# Altium schematic sheet PFC-Sheet.SchDoc (part 1 of 4)
size 420 x 297 mm; SheetNumber: 2; SheetTotal: 4
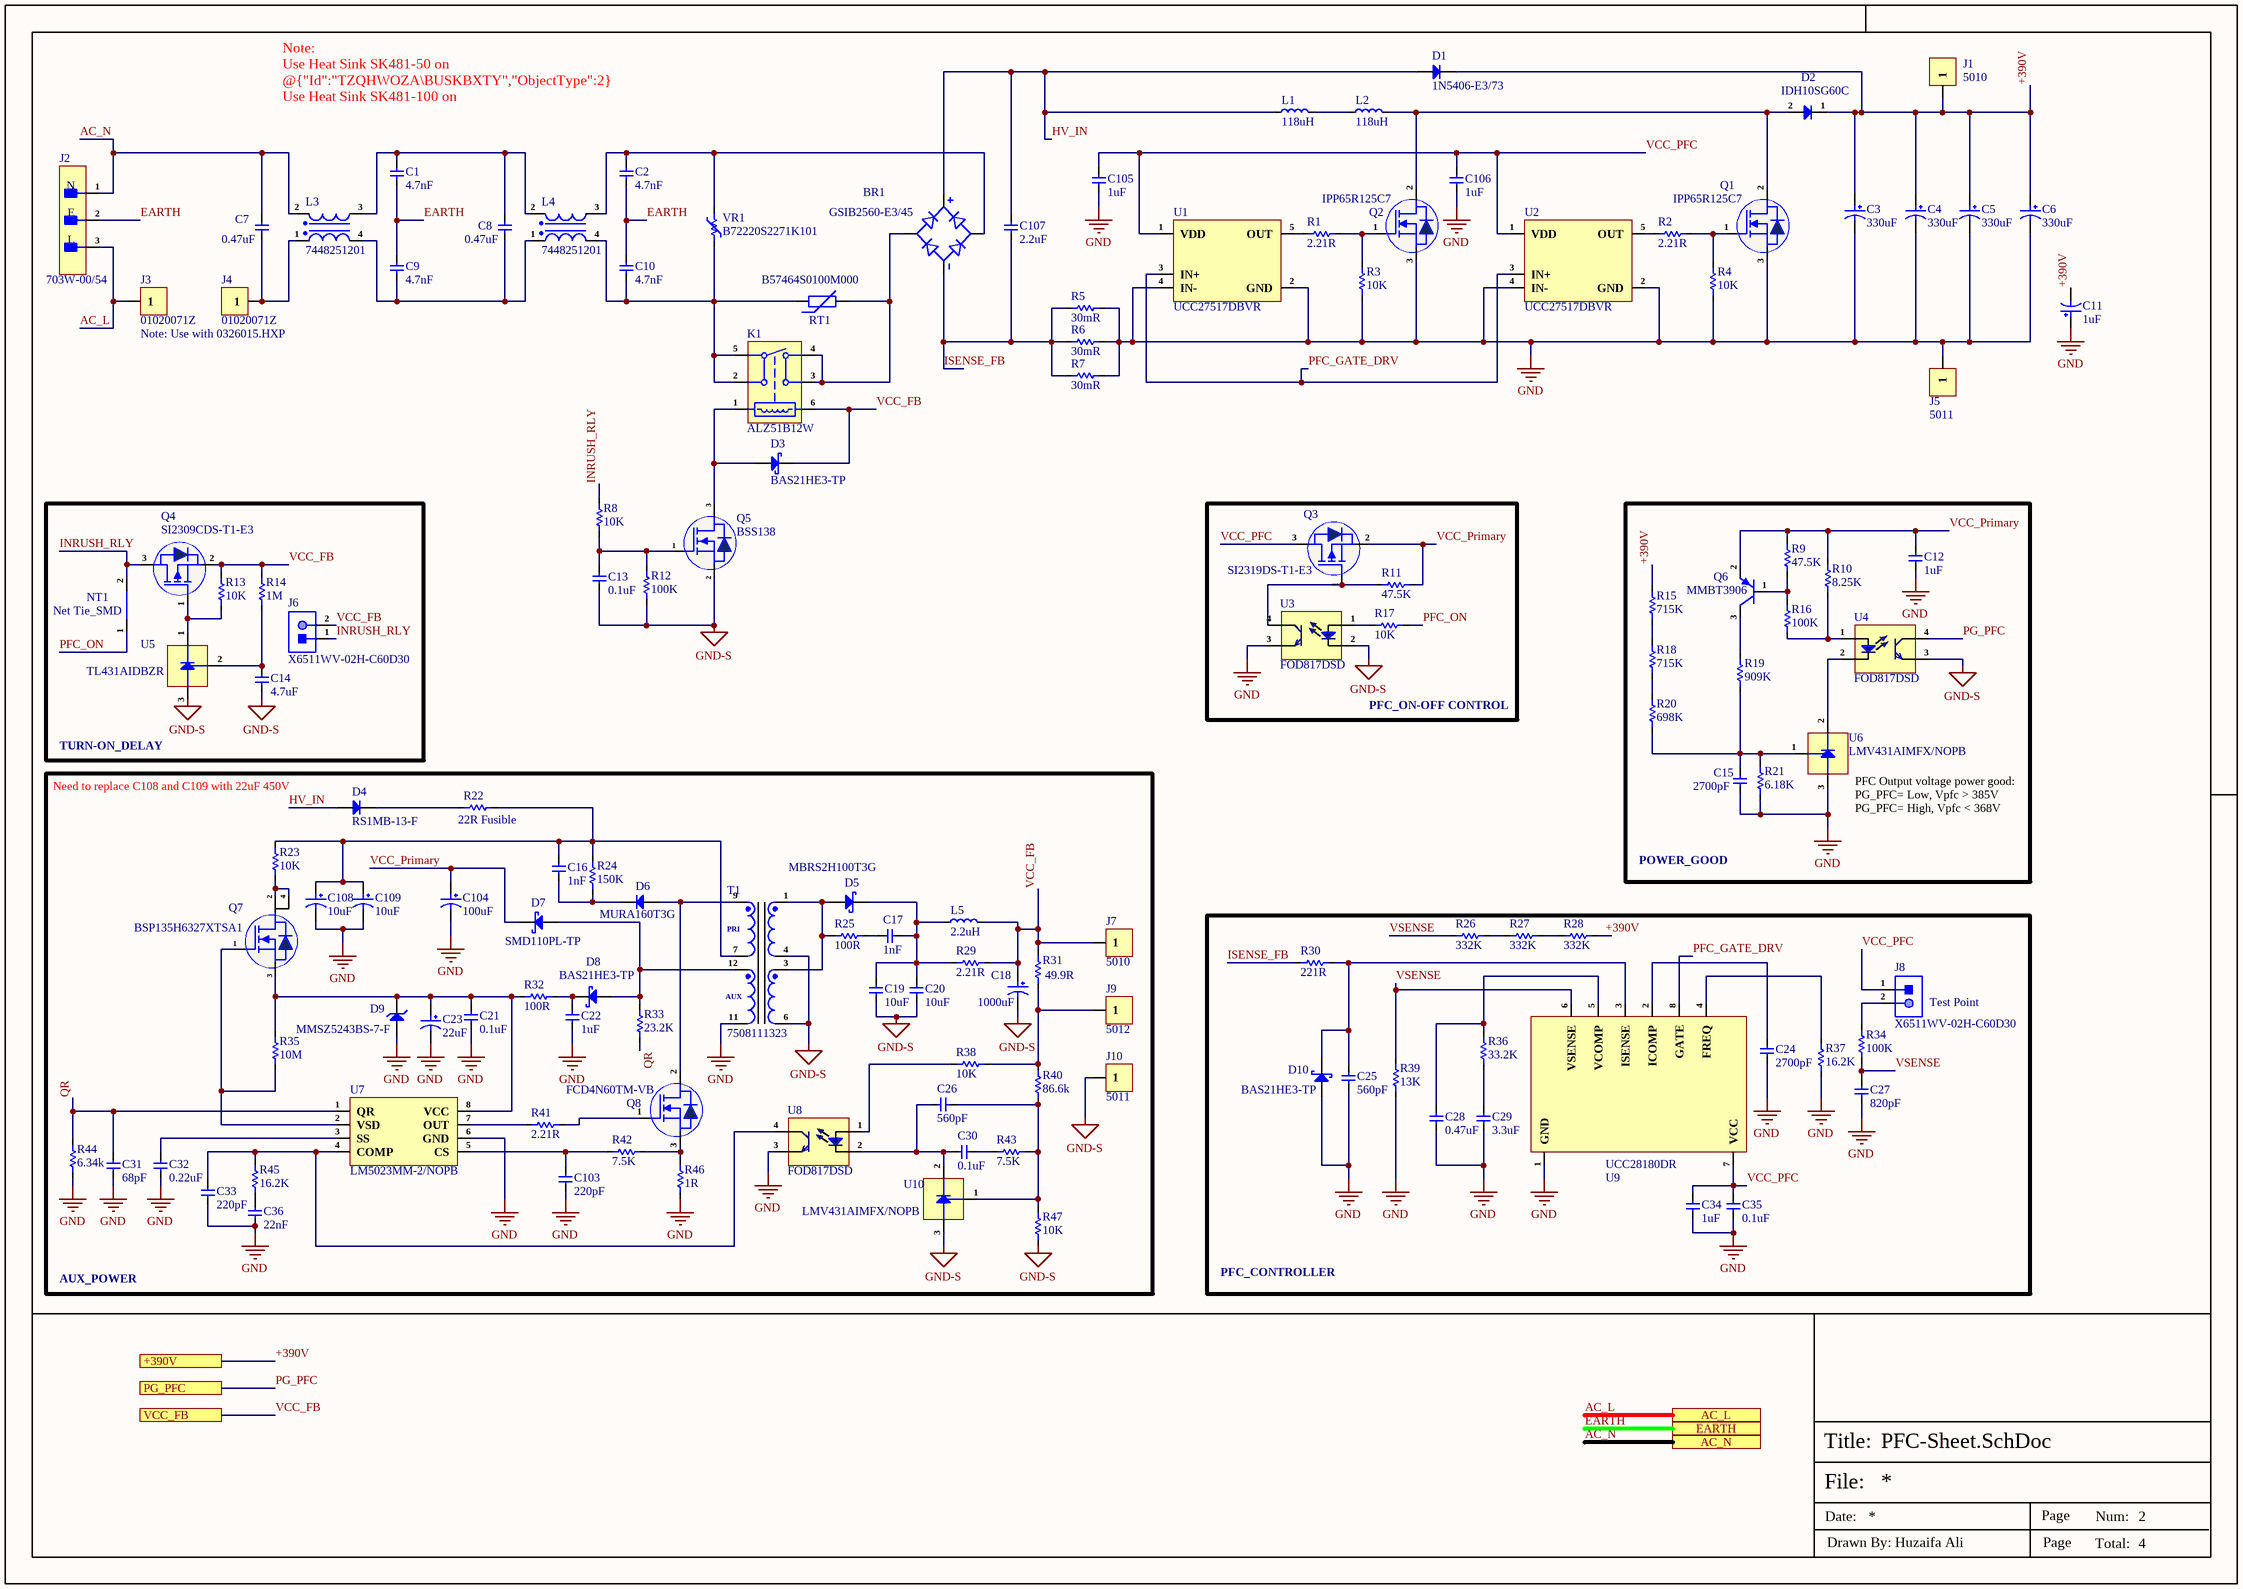
[diagram p0: PFC-Sheet.SchDoc]

## Parts
BR1  GSIB2560-E3/45  [GSIB-5S]
C1  4.7nF  [C771U472MYWDBA7317]
C2  4.7nF  [C771U472MYWDBA7317]
C3  330uF  [381LR331M450K052]
C4  330uF  [381LR331M450K052]
C5  330uF  [381LR331M450K052]
C6  330uF  [381LR331M450K052]
C7  0.47uF  [B32933A3474M000]
C8  0.47uF  [B32933A3474M000]
C9  4.7nF  [C771U472MYWDBA7317]
C10  4.7nF  [C771U472MYWDBA7317]
C11  1uF  [R75PR4100AA30K]
C12  1uF  [Cap-0603]
C13  0.1uF  [Cap-0603]
C14  4.7uF  [Cap-0603]
C15  2700pF  [Cap-0603]
C16  1nF  [Cap-0805]
C17  1nF  [Cap-0805]
C18  1000uF  [EEU-FM1C102B]
C19  10uF  [Cap-1210]
C20  10uF  [Cap-1210]
C21  0.1uF  [Cap-0603]
C22  1uF  [Cap-0603]
C23  22uF  [EEEFK1H220P]
C24  2700pF  [Cap-0603]
C25  560pF  [Cap-0603]
C26  560pF  [Cap-0603]
C27  820pF  [Cap-0603]
C28  0.47uF  [Cap-0603]
C29  3.3uF  [Cap-1210]
C30  0.1uF  [Cap-0603]
C31  68pF  [Cap-0603]
C32  0.22uF  [Cap-0603]
C33  220pF  [Cap-0603]
C34  1uF  [Cap-0603]
C35  0.1uF  [Cap-0603]
C36  22nF  [Cap-0603]
C103  220pF  [Cap-0603]
C104  100uF  [25SVPF100M.]
C105  1uF  [Cap-0603]
C106  1uF  [Cap-0603]
C107  2.2uF  [ECW-FA2J225J]
C108  10uF  [ERK2GM100G10OT]
C109  10uF  [ERK2GM100G10OT]
D1  1N5406-E3/73  [DO-201AD]
D2  IDH10SG60C  [TO-220-2]
D3  BAS21HE3-TP  [SOT-23]
D4  RS1MB-13-F  [SMB_]
D5  MBRS2H100T3G  [SMB_]
D6  MURA160T3G  [SMA]
D7  SMD110PL-TP  [SOD-123FL]
D8  BAS21HE3-TP  [SOT-23]
D9  MMSZ5243BS-7-F  [SOD-323]
D10  BAS21HE3-TP  [SOT-23]
J1  5010  [5010]
J2  703W-00/54  [703W-00/54]
J3  01020071Z  [01020071Z]
J4  01020071Z  [01020071Z]
J5  5011  [5011]
J6  X6511WV-02H-C60D30  [HDR1X2_]
J7  5010  [5010]
J8  X6511WV-02H-C60D30  [HDR1X2_]
J9  5012  [5012]
J10  5011  [5011]
K1  ALZ51B12W  [ALZ51B12W]
L1  118uH  [760801401]
L2  118uH  [760801401]
L3  7448251201  [7448251201]
L4  7448251201  [7448251201]
L5  2.2uH  [7447745022]
NT1  Net Tie_SMD  [Net Tie Pad]  (net tie, no BOM)
Q1  IPP65R125C7  [TO-220-3]
Q2  IPP65R125C7  [TO-220-3]
Q3  SI2319DS-T1-E3  [SOT-23]
Q4  SI2309CDS-T1-E3  [SOT-23]
Q5  BSS138  [Sot-23]
Q6  MMBT3906  [SOT-23]
Q7  BSP135H6327XTSA1  [SOT- 223]
Q8  FCD4N60TM-VB  [TO-252-2L]
R1  2.21R  [RES-0805]
R2  2.21R  [RES-0805]
R3  10K  [Res-0603]
R4  10K  [Res-0603]
R5  30mR  [RES-2512]
R6  30mR  [RES-2512]
R7  30mR  [RES-2512]
R8  10K  [Res-0603]
R9  47.5K  [Res-0603]
R10  8.25K  [Res-0603]
R11  47.5K  [Res-0603]
R12  100K  [Res-0603]
R13  10K  [Res-0603]
R14  1M  [RES-0805]
R15  715K  [Res-1206]
R16  100K  [Res-0603]
R17  10K  [Res-0603]
R18  715K  [Res-1206]
R19  909K  [Res-0603]
R20  698K  [Res-1206]
R21  6.18K  [Res-0603]
R22  22R Fusible  [EMC2-22RKI]
R23  10K  [RES-2512]
R24  150K  [RES-2010]
R25  100R  [Res-1206]
R26  332K  [Res-1206]
R27  332K  [Res-1206]
R28  332K  [Res-1206]
R29  2.21R  [RES-0805]
R30  221R  [Res-0603]
R31  49.9R  [Res-0603]
R32  100R  [Res-1206]
R33  23.2K  [Res-0603]
R34  100K  [Res-0603]
R35  10M  [Res-1206]
R36  33.2K  [Res-0603]
R37  16.2K  [Res-0603]
R38  10K  [Res-0603]
R39  13K  [Res-0603]
R40  86.6k  [Res-0603]
R41  2.21R  [RES-0805]
R42  7.5K  [Res-0603]
R43  7.5K  [Res-0603]
R44  6.34k  [Res-0603]
R45  16.2K  [Res-0603]
R46  1R  [Res-1206]
R47  10K  [Res-0603]
RT1  B57464S0100M000  [B57464S0100M000]
T1  7508111323  [7508111323]
U1  UCC27517DBVR  [SOT-23-5]
U2  UCC27517DBVR  [SOT-23-5]
U3  FOD817DSD  [FOD817DSD]
U4  FOD817DSD  [FOD817DSD]
U5  TL431AIDBZR  [SOT-23]
U6  LMV431AIMFX/NOPB  [SOT-23]
U7  LM5023MM-2/NOPB  [VSSOP-8-0.65mm]
U8  FOD817DSD  [FOD817DSD]
U9  UCC28180DR  [SOIC-8]
U10  LMV431AIMFX/NOPB  [SOT-23]
VR1  B72220S2271K101  [B72220S2271K101]

## Blocks framed on the sheet
TURN-ON_DELAY: C14 J6 NT1 Q4 R13 R14 U5
PFC_ON-OFF CONTROL: Q3 R11 R17 U3
POWER_GOOD: C12 C15 Q6 R9 R10 R15 R16 R18-R21 U4 U6

## Ports
+390V (see Top-Sheet[2B], Power-Sheet[1D]), AC_L (see Top-Sheet[1B]), AC_N (see Top-Sheet[1B]), EARTH (see Top-Sheet[1B], Power-Sheet[5D]), PG_PFC (see Top-Sheet[2B], Control-Sheet[1D], Power-Sheet[1D]), VCC_FB (see Top-Sheet[2B], Control-Sheet[1D], Power-Sheet[1D])

## Nets
GND: C3.2 C4.2 C5.2 C6.2 C11.1 C12.1 C15.1 C21.1 C22.1 C23.2 C24.1 C25.1 C27.1 C28.1 C29.1 C31.1 C32.1 C33.1 C34.1 C35.1 C36.1 C103.1 C104.2 C105.1 C106.1 C108.2 C109.2 D9.2(A) D10.1(A) J5.1 Q1.3(S) Q2.3(S) R3.1 R4.1 R5.2 R6.2 R7.2 R21.1 R37.2 R39.1 R44.1 R46.1 T1.11 U1.2(GND) U1.4(IN-) U2.2(GND) U2.4(IN-) U3.3(E) U6.3(Anode) U7.6(GND) U8.3(E) U9.1(GND)
GND-S: C13.1 C14.1 C18.2 C19.1 C20.1 J10.1 Q5.2(S) R12.1 R47.1 T1.4 T1.6 U3.2(Ca) U4.3(E) U5.3(Anode) U10.3(Anode)
+390V: C3.1 C4.1 C5.1 C6.1 C11.2 D1.1(K) D2.1(K) J1.1 R15.2 R28.2 ; port +390V
AC_L: J2.3(L) J3.1 ; port AC_L
AC_N: C7.2 J2.1(N) L3.2 ; port AC_N
EARTH: C1.1 C2.1 C9.2 C10.2 J2.2(E) ; port EARTH
HV_IN: BR1.POS C107.2 D1.2(A) D4.1(A) L1.1
INRUSH_RLY: J6.1 NT1.2 Q4.3(D) R8.2
ISENSE_FB: BR1.NEG C107.1 R5.1 R6.1 R7.1 R30.1
PFC_GATE_DRV: U1.3(IN+) U2.3(IN+) U9.8(GATE)
PFC_ON: NT1.1 R17.2
PG_PFC: U4.4(C) ; port PG_PFC
QR: C31.2 R33.1 R44.2 U7.1(QR)
VCC_FB: C18.1 D3.3(K) J6.2 J7.1 K1.6 L5.2 Q4.2(S) R13.2 R14.2 R29.2 R31.2 ; port VCC_FB
VCC_PFC: C34.2 C35.2 C105.2 C106.2 J8.1 Q3.3(D) U1.1(VDD) U2.1(VDD) U9.7(VCC)
VCC_Primary: C12.2 C104.1 D7.1(K) Q3.2(S) Q6.2(E) R9.2 R10.2 R11.2
VSENSE: C27.2 R26.1 R34.1 R39.2 U9.6(VSENSE)
NetBR1_AC1: BR1.AC1 C2.2 L4.3 VR1.2
NetBR1_AC2: BR1.AC2 K1.3 K1.4 RT1.2
NetC1_2: C1.2 C8.2 L3.3 L4.2
NetC7_1: C7.1 J4.1 L3.1
NetC8_1: C8.1 C9.1 L3.4 L4.1
NetC10_1: C10.1 K1.2 K1.5 L4.4 RT1.1 VR1.1
NetC13_2: C13.2 Q5.1(G) R8.1 R12.2
NetC14_2: C14.2 R14.1 U5.2(REF)
NetC15_2: C15.2 R19.1 R20.1 R21.2 U6.1(REF)
NetC16_1: C16.1 D6.1(K) R24.1
NetC16_2: C16.2 C108.1 C109.1 R22.1 R23.2 R24.2 T1.7
NetC17_1: C17.1 C19.2 C20.2 D5.2(K) L5.1 R29.1
NetC17_2: C17.2 R25.2
NetC21_2: C21.2 C23.1 D9.1(K) Q7.3(S) R32.1 R35.2 U7.8(VCC)
NetC22_2: C22.2 D8.3(K) R32.2
NetC24_2: C24.2 U9.2(ICOMP)
NetC25_2: C25.2 D10.3(K) R30.2 U9.3(ISENSE)
NetC26_1: C26.1 C30.2 U8.2(Ca) U10.2(Cathode)
NetC26_2: C26.2 R40.1 R43.2 R47.2 U10.1(REF)
NetC28_2: C28.2 R36.2 U9.5(VCOMP)
NetC29_2: C29.2 R36.1
NetC30_1: C30.1 R43.1
NetC32_2: C32.2 U7.3(SS)
NetC33_2: C33.2 R45.2 U7.4(COMP) U8.4(C)
NetC36_2: C36.2 R45.1
NetC103_2: C103.2 R42.1 U7.5(CS)
NetD2_2: D2.2(A) L2.2 Q1.2(D) Q2.2(D)
NetD3_1: D3.1(A) K1.1 Q5.3(D)
NetD4_2: D4.2(K) R22.2
NetD5_1: D5.1(A) R25.1 T1.1 T1.3
NetD6_2: D6.2(A) Q8.2(D) T1.9
NetD7_2: D7.2(A) D8.1(A) R33.2 T1.12
NetJ8_2: J8.2 R34.2
NetJ9_1: J9.1 R31.1 R38.2 R40.2
NetL1_2: L1.2 L2.1
NetQ1_1: Q1.1(G) R2.2 R4.2
NetQ2_1: Q2.1(G) R1.2 R3.2
NetQ3_1: Q3.1(G) R11.1 U3.4(C)
NetQ4_1: Q4.1(G) R13.1 U5.1(Cathode)
NetQ6_1: Q6.1(B) R9.1 R16.2
NetQ6_3: Q6.3(C) R19.2
NetQ7_1: Q7.1(G) R35.1 U7.2(VSD)
NetQ7_2: Q7.2(D) Q7.4(D) R23.1
NetQ8_1: Q8.1(G) R41.2
NetQ8_3: Q8.3(S) R42.2 R46.2
NetR1_1: R1.1 U1.5(OUT)
NetR2_1: R2.1 U2.5(OUT)
NetR10_1: R10.1 R16.1 U4.1(An)
NetR15_1: R15.1 R18.2
NetR17_1: R17.1 U3.1(An)
NetR18_1: R18.1 R20.2
NetR26_2: R26.2 R27.1
NetR27_2: R27.2 R28.1
NetR37_1: R37.1 U9.4(FREQ)
NetR38_1: R38.1 U8.1(An)
NetR41_1: R41.1 U7.7(OUT)
NetU4_2: U4.2(Ca) U6.2(Cathode)

## Notes on the sheet
- Note:
  Use Heat Sink SK481-50 on @{"Id":"TZQHWOZA\BUSKBXTY","ObjectType":2}
  Use Heat Sink SK481-100 on @{"Id":"TZQHWOZA\QHEAVWIM","ObjectType":2} @{"Id":"TZQHWOZA\GOCLJIOY","ObjectType":2} & @{"Id":"TZQHWOZA\RKNUICFK","ObjectType":2}
- Note: Use with 0326015.HXP
- Need to replace C108 and C109 with 22uF 450V
- (near U6) PFC Output voltage power good:
  PG_PFC= Low, Vpfc > 385V
  PG_PFC= High, Vpfc < 368V
- (near J8) Test Point
- AUX_POWER
- PFC_CONTROLLER
- File:
- Title:
- Date:
- Page
- Num:
- Total:
- Drawn By: Huzaifa Ali
- (in symbol 7508111323) PRI; AUX